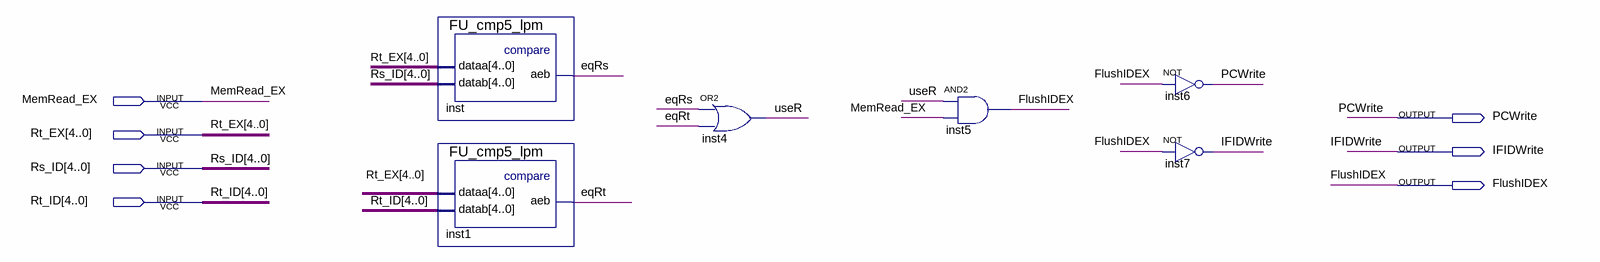
[diagram p0: schematic sheet]
// Quartus schematic HDU.bdf as structural Verilog: 6 symbols, 7 pins
module HDU (
  input  MemRead_EX,
  input  [4:0] Rt_EX,
  input  [4:0] Rs_ID,
  input  [4:0] Rt_ID,
  output PCWrite,
  output IFIDWrite,
  output FlushIDEX
);

  wire eqRs, eqRt, useR;

  FU_cmp5_lpm inst (.dataa(Rt_EX), .datab(Rs_ID), .aeb(eqRs));
  FU_cmp5_lpm inst1 (.dataa(Rt_EX), .datab(Rt_ID), .aeb(eqRt));
  or inst4 (useR, eqRs, eqRt);
  and inst5 (FlushIDEX, useR, MemRead_EX);
  not inst6 (PCWrite, FlushIDEX);
  not inst7 (IFIDWrite, FlushIDEX);
endmodule
